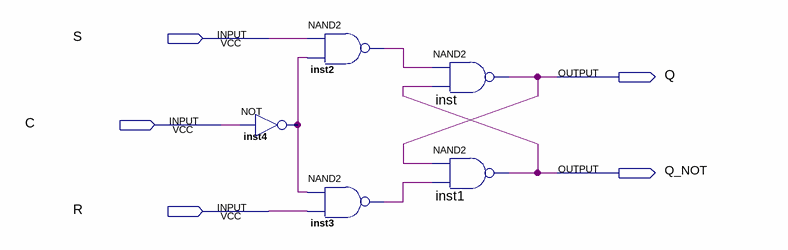
[diagram p0: schematic sheet]
// Quartus schematic WILLIAMS_DWANN_SR_GATED_LATCH.bdf as structural Verilog: 5 symbols, 5 pins
module WILLIAMS_DWANN_SR_GATED_LATCH (
  input  S,
  input  C,
  input  R,
  output Q,
  output Q_NOT
);

  wire inst2_out, inst3_out, inst4_out;

  not inst4 (inst4_out, C);
  nand inst2 (inst2_out, S, inst4_out);
  nand inst3 (inst3_out, inst4_out, R);
  nand inst (Q, inst2_out, Q_NOT);
  nand inst1 (Q_NOT, Q, inst3_out);
endmodule
